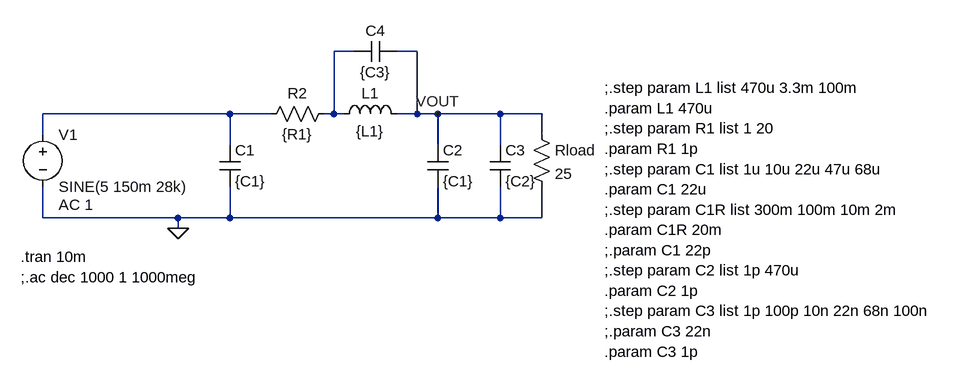
[diagram p0: schematic filter_pi_50kHz.asc]
filter_pi_50kHz.asc, the LTspice schematic file:
Version 4
SHEET 1 1252 680
WIRE 240 32 208 32
WIRE 336 32 304 32
WIRE 48 128 -240 128
WIRE 112 128 48 128
WIRE 208 128 208 32
WIRE 208 128 192 128
WIRE 224 128 208 128
WIRE 336 128 336 32
WIRE 336 128 304 128
WIRE 368 128 336 128
WIRE 464 128 368 128
WIRE 528 128 464 128
WIRE -240 160 -240 128
WIRE 528 160 528 128
WIRE 48 176 48 128
WIRE 368 176 368 128
WIRE 464 176 464 128
WIRE -240 288 -240 240
WIRE -32 288 -240 288
WIRE 48 288 48 240
WIRE 48 288 -32 288
WIRE 368 288 368 240
WIRE 368 288 48 288
WIRE 464 288 464 240
WIRE 464 288 368 288
WIRE 528 288 528 240
WIRE 528 288 464 288
WIRE -32 304 -32 288
FLAG -32 304 0
FLAG 368 128 VOUT
SYMBOL cap 32 176 R0
SYMATTR InstName C1
SYMATTR Value {C1}
SYMATTR SpiceLine Rser={C1R} Lser=2n
SYMBOL ind 208 144 R270
WINDOW 0 32 56 VTop 2
WINDOW 3 5 56 VBottom 2
SYMATTR InstName L1
SYMATTR Value {L1}
SYMATTR SpiceLine Rser=5.5 Cpar=1p
SYMBOL voltage -240 144 R0
WINDOW 123 24 124 Left 2
WINDOW 39 0 0 Left 0
SYMATTR InstName V1
SYMATTR Value SINE(5 150m 28k)
SYMATTR Value2 AC 1
SYMBOL cap 352 176 R0
SYMATTR InstName C2
SYMATTR Value {C1}
SYMATTR SpiceLine Rser={C1R} Lser=3n
SYMBOL res 512 144 R0
SYMATTR InstName Rload
SYMATTR Value 25
SYMBOL res 208 112 R90
WINDOW 0 0 56 VBottom 2
WINDOW 3 32 56 VTop 2
SYMATTR InstName R2
SYMATTR Value {R1}
SYMBOL cap 448 176 R0
SYMATTR InstName C3
SYMATTR Value {C2}
SYMATTR SpiceLine Rser=0.16 Lser=3n
SYMBOL cap 304 16 R90
WINDOW 0 0 32 VBottom 2
WINDOW 3 32 32 VTop 2
SYMATTR InstName C4
SYMATTR Value {C3}
TEXT 624 88 Left 2 !;.step param L1 list 470u 3.3m 100m\n.param L1 470u\n;.step param R1 list 1 20\n.param R1 1p\n;.step param C1 list 1u 10u 22u 47u 68u\n.param C1 22u\n;.step param C1R list 300m 100m 10m 2m\n.param C1R 20m\n;.param C1 22p\n;.step param C2 list 1p 470u\n.param C2 1p\n;.step param C3 list 1p 100p 10n 22n 68n 100n\n;.param C3 22n\n.param C3 1p
TEXT -274 348 Left 2 !.tran 10m\n;.ac dec 1000 1 1000meg

The netlist it stands for:
* filter_pi_50kHz.asc
C1 N002 0 {C1} Rser={C1R} Lser=2n
L1 N001 VOUT {L1} Rser=5.5 Cpar=1p
V1 N002 0 SINE(5 150m 28k) AC 1
C2 VOUT 0 {C1} Rser={C1R} Lser=3n
Rload VOUT 0 25
R2 N001 N002 {R1}
C3 VOUT 0 {C2} Rser=0.16 Lser=3n
C4 VOUT N001 {C3}
;.step param L1 list 470u 3.3m 100m
.param L1 470u
;.step param R1 list 1 20
.param R1 1p
;.step param C1 list 1u 10u 22u 47u 68u
.param C1 22u
;.step param C1R list 300m 100m 10m 2m
.param C1R 20m
;.param C1 22p
;.step param C2 list 1p 470u
.param C2 1p
;.step param C3 list 1p 100p 10n 22n 68n 100n
;.param C3 22n
.param C3 1p
.tran 10m
;.ac dec 1000 1 1000meg
.backanno
.end